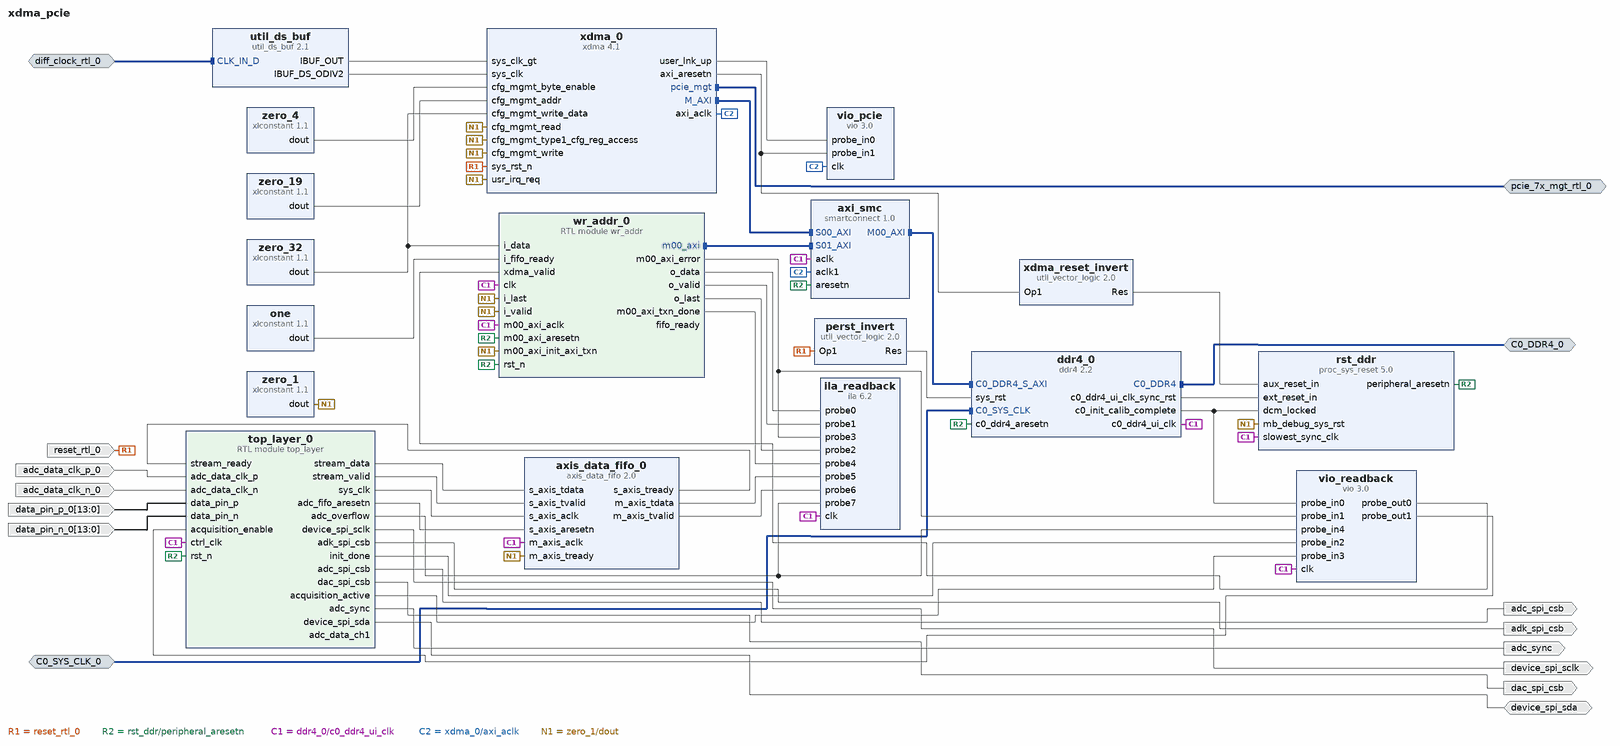
[diagram p0: block diagram of the top level]
# Vivado block design xdma_pcie, xcku060-ffva1156-2-i, Vivado 2018.3
create_bd_design xdma_pcie

create_bd_intf_port -mode Master -vlnv xilinx.com:interface:ddr4_rtl:1.0 C0_DDR4_0
create_bd_intf_port -mode Slave -vlnv xilinx.com:interface:diff_clock_rtl:1.0 C0_SYS_CLK_0
create_bd_intf_port -mode Master -vlnv xilinx.com:interface:pcie_7x_mgt_rtl:1.0 pcie_7x_mgt_rtl_0
create_bd_intf_port -mode Slave -vlnv xilinx.com:interface:diff_clock_rtl:1.0 diff_clock_rtl_0
set_property -dict {CONFIG.FREQ_HZ 100000000} [get_bd_intf_ports diff_clock_rtl_0]
create_bd_port -dir I -type rst reset_rtl_0
set_property -dict {CONFIG.POLARITY ACTIVE_LOW} [get_bd_ports reset_rtl_0]
create_bd_port -dir I -type clk adc_data_clk_p_0
set_property -dict {CONFIG.FREQ_HZ 125000000} [get_bd_ports adc_data_clk_p_0]
create_bd_port -dir I -type clk adc_data_clk_n_0
set_property -dict {CONFIG.FREQ_HZ 125000000} [get_bd_ports adc_data_clk_n_0]
create_bd_port -dir I -from 13 -to 0 data_pin_p_0
create_bd_port -dir I -from 13 -to 0 data_pin_n_0
create_bd_port -dir O device_spi_sclk
create_bd_port -dir O adk_spi_csb
create_bd_port -dir O adc_spi_csb
create_bd_port -dir O dac_spi_csb
create_bd_port -dir O adc_sync
create_bd_port -dir IO device_spi_sda

create_bd_cell -type ip -vlnv xilinx.com:ip:ddr4:2.2 ddr4_0
set_property -dict [list \
  CONFIG.C0.BANK_GROUP_WIDTH 1 \
  CONFIG.C0.DDR4_AxiAddressWidth 32 \
  CONFIG.C0.DDR4_AxiDataWidth 512 \
  CONFIG.C0.DDR4_CasLatency 11 \
  CONFIG.C0.DDR4_CasWriteLatency 9 \
  CONFIG.C0.DDR4_DataWidth 64 \
  CONFIG.C0.DDR4_InputClockPeriod 10000 \
  CONFIG.C0.DDR4_MemoryPart MT40A512M16HA-083E \
  CONFIG.C0.DDR4_Specify_MandD false \
  CONFIG.C0.DDR4_TimePeriod 1250 \
  CONFIG.System_Clock Differential \
] [get_bd_cells ddr4_0]
create_bd_cell -type ip -vlnv xilinx.com:ip:xdma:4.1 xdma_0
set_property -dict [list \
  CONFIG.PF0_DEVICE_ID_mqdma 9028 \
  CONFIG.PF2_DEVICE_ID_mqdma 9028 \
  CONFIG.PF3_DEVICE_ID_mqdma 9028 \
  CONFIG.axi_data_width 256_bit \
  CONFIG.axilite_master_en false \
  CONFIG.axisten_freq 125 \
  CONFIG.en_gt_selection true \
  CONFIG.pcie_blk_locn X0Y1 \
  CONFIG.pf0_device_id 8028 \
  CONFIG.pl_link_cap_max_link_speed 5.0_GT/s \
  CONFIG.pl_link_cap_max_link_width X8 \
  CONFIG.plltype QPLL1 \
  CONFIG.select_quad GTH_Quad_227 \
  CONFIG.xdma_axi_intf_mm AXI_Memory_Mapped \
  CONFIG.xdma_axilite_slave false \
] [get_bd_cells xdma_0]
create_bd_cell -type ip -vlnv xilinx.com:ip:util_ds_buf:2.1 util_ds_buf
set_property -dict {CONFIG.C_BUF_TYPE IBUFDSGTE} [get_bd_cells util_ds_buf]
create_bd_cell -type ip -vlnv xilinx.com:ip:axis_data_fifo:2.0 axis_data_fifo_0
set_property -dict [list \
  CONFIG.FIFO_DEPTH 4096 \
  CONFIG.FIFO_MODE 1 \
  CONFIG.HAS_TKEEP 0 \
  CONFIG.HAS_TLAST 0 \
  CONFIG.HAS_TSTRB 0 \
  CONFIG.IS_ACLK_ASYNC 1 \
  CONFIG.TDATA_NUM_BYTES 4 \
  CONFIG.TID_WIDTH 0 \
  CONFIG.TUSER_WIDTH 0 \
] [get_bd_cells axis_data_fifo_0]
create_bd_cell -type ip -vlnv xilinx.com:ip:smartconnect:1.0 axi_smc
set_property -dict {CONFIG.NUM_CLKS 2 CONFIG.NUM_MI 1 CONFIG.NUM_SI 2} [get_bd_cells axi_smc]
create_bd_cell -type ip -vlnv xilinx.com:ip:util_vector_logic:2.0 perst_invert
set_property -dict {CONFIG.C_OPERATION not CONFIG.C_SIZE 1} [get_bd_cells perst_invert]
create_bd_cell -type ip -vlnv xilinx.com:ip:util_vector_logic:2.0 xdma_reset_invert
set_property -dict {CONFIG.C_OPERATION not CONFIG.C_SIZE 1} [get_bd_cells xdma_reset_invert]
create_bd_cell -type ip -vlnv xilinx.com:ip:proc_sys_reset:5.0 rst_ddr
set_property -dict {CONFIG.C_AUX_RESET_HIGH 1} [get_bd_cells rst_ddr]
create_bd_cell -type ip -vlnv xilinx.com:ip:xlconstant:1.1 zero_1
set_property -dict {CONFIG.CONST_VAL 0 CONFIG.CONST_WIDTH 1} [get_bd_cells zero_1]
create_bd_cell -type ip -vlnv xilinx.com:ip:xlconstant:1.1 zero_4
set_property -dict {CONFIG.CONST_VAL 0 CONFIG.CONST_WIDTH 4} [get_bd_cells zero_4]
create_bd_cell -type ip -vlnv xilinx.com:ip:xlconstant:1.1 zero_19
set_property -dict {CONFIG.CONST_VAL 0 CONFIG.CONST_WIDTH 19} [get_bd_cells zero_19]
create_bd_cell -type ip -vlnv xilinx.com:ip:xlconstant:1.1 zero_32
set_property -dict {CONFIG.CONST_VAL 0 CONFIG.CONST_WIDTH 32} [get_bd_cells zero_32]
create_bd_cell -type ip -vlnv xilinx.com:ip:xlconstant:1.1 one
set_property -dict {CONFIG.CONST_VAL 1} [get_bd_cells one]
create_bd_cell -type ip -vlnv xilinx.com:ip:vio:3.0 vio_readback
set_property -dict [list \
  CONFIG.C_NUM_PROBE_IN 5 \
  CONFIG.C_NUM_PROBE_OUT 2 \
  CONFIG.C_PROBE_OUT0_INIT_VAL 0x0 \
  CONFIG.C_PROBE_OUT1_INIT_VAL 0x0 \
] [get_bd_cells vio_readback]
create_bd_cell -type ip -vlnv xilinx.com:ip:ila:6.2 ila_readback
set_property -dict [list \
  CONFIG.C_DATA_DEPTH 1024 \
  CONFIG.C_MONITOR_TYPE Native \
  CONFIG.C_NUM_OF_PROBES 8 \
  CONFIG.C_PROBE0_WIDTH 32 \
  CONFIG.C_PROBE1_WIDTH 1 \
  CONFIG.C_PROBE2_WIDTH 1 \
  CONFIG.C_PROBE3_WIDTH 1 \
  CONFIG.C_PROBE4_WIDTH 1 \
  CONFIG.C_PROBE5_WIDTH 32 \
  CONFIG.C_PROBE6_WIDTH 1 \
  CONFIG.C_PROBE7_WIDTH 1 \
] [get_bd_cells ila_readback]
create_bd_cell -type ip -vlnv xilinx.com:ip:vio:3.0 vio_pcie
set_property -dict {CONFIG.C_NUM_PROBE_IN 2 CONFIG.C_NUM_PROBE_OUT 0} [get_bd_cells vio_pcie]
create_bd_cell -type module -reference wr_addr wr_addr_0
create_bd_cell -type module -reference top_layer top_layer_0

# ---- connections ----

connect_bd_intf_net [get_bd_intf_ports C0_DDR4_0] [get_bd_intf_pins ddr4_0/C0_DDR4]
connect_bd_intf_net -intf_net diff_clock_rtl_0_1 [get_bd_intf_ports diff_clock_rtl_0] [get_bd_intf_pins util_ds_buf/CLK_IN_D]
connect_bd_intf_net [get_bd_intf_ports pcie_7x_mgt_rtl_0] [get_bd_intf_pins xdma_0/pcie_mgt]
connect_bd_intf_net -intf_net C0_SYS_CLK_0_1 [get_bd_intf_ports C0_SYS_CLK_0] [get_bd_intf_pins ddr4_0/C0_SYS_CLK]
connect_bd_intf_net [get_bd_intf_pins xdma_0/M_AXI] [get_bd_intf_pins axi_smc/S00_AXI]
connect_bd_intf_net [get_bd_intf_pins wr_addr_0/m00_axi] [get_bd_intf_pins axi_smc/S01_AXI]
connect_bd_intf_net [get_bd_intf_pins axi_smc/M00_AXI] [get_bd_intf_pins ddr4_0/C0_DDR4_S_AXI]
connect_bd_net -net reset_rtl_0_1 [get_bd_ports reset_rtl_0] [get_bd_pins xdma_0/sys_rst_n] [get_bd_pins perst_invert/Op1]
connect_bd_net [get_bd_pins util_ds_buf/IBUF_OUT] [get_bd_pins xdma_0/sys_clk_gt]
connect_bd_net [get_bd_pins util_ds_buf/IBUF_DS_ODIV2] [get_bd_pins xdma_0/sys_clk]
connect_bd_net -net AXI_data_out_0_0_data [get_bd_pins top_layer_0/stream_data] [get_bd_pins axis_data_fifo_0/s_axis_tdata]
connect_bd_net -net AXI_data_out_0_0_valid [get_bd_pins top_layer_0/stream_valid] [get_bd_pins axis_data_fifo_0/s_axis_tvalid]
connect_bd_net [get_bd_pins axis_data_fifo_0/s_axis_tready] [get_bd_pins top_layer_0/stream_ready]
connect_bd_net [get_bd_pins rst_ddr/peripheral_aresetn] \
  [get_bd_pins ddr4_0/c0_ddr4_aresetn] [get_bd_pins axi_smc/aresetn] [get_bd_pins wr_addr_0/rst_n] \
  [get_bd_pins wr_addr_0/m00_axi_aresetn] [get_bd_pins top_layer_0/rst_n]
connect_bd_net [get_bd_pins perst_invert/Res] [get_bd_pins ddr4_0/sys_rst]
connect_bd_net [get_bd_pins xdma_0/axi_aresetn] [get_bd_pins xdma_reset_invert/Op1] [get_bd_pins vio_pcie/probe_in1]
connect_bd_net [get_bd_pins ddr4_0/c0_ddr4_ui_clk_sync_rst] [get_bd_pins rst_ddr/ext_reset_in]
connect_bd_net [get_bd_pins xdma_reset_invert/Res] [get_bd_pins rst_ddr/aux_reset_in]
connect_bd_net [get_bd_pins ddr4_0/c0_init_calib_complete] [get_bd_pins rst_ddr/dcm_locked] [get_bd_pins vio_readback/probe_in0]
connect_bd_net [get_bd_pins ddr4_0/c0_ddr4_ui_clk] \
  [get_bd_pins axi_smc/aclk] [get_bd_pins rst_ddr/slowest_sync_clk] [get_bd_pins vio_readback/clk] \
  [get_bd_pins ila_readback/clk] [get_bd_pins wr_addr_0/clk] [get_bd_pins wr_addr_0/m00_axi_aclk] \
  [get_bd_pins top_layer_0/ctrl_clk] [get_bd_pins axis_data_fifo_0/m_axis_aclk]
connect_bd_net [get_bd_pins xdma_0/axi_aclk] [get_bd_pins axi_smc/aclk1] [get_bd_pins vio_pcie/clk]
connect_bd_net [get_bd_pins axis_data_fifo_0/m_axis_tdata] [get_bd_pins ila_readback/probe5]
connect_bd_net [get_bd_pins axis_data_fifo_0/m_axis_tvalid] [get_bd_pins ila_readback/probe6]
# net wr_addr_0_fifo_ready has one end: wr_addr_0/fifo_ready
connect_bd_net [get_bd_pins zero_1/dout] \
  [get_bd_pins rst_ddr/mb_debug_sys_rst] [get_bd_pins xdma_0/usr_irq_req] [get_bd_pins xdma_0/cfg_mgmt_read] \
  [get_bd_pins xdma_0/cfg_mgmt_write] [get_bd_pins xdma_0/cfg_mgmt_type1_cfg_reg_access] \
  [get_bd_pins wr_addr_0/m00_axi_init_axi_txn] [get_bd_pins axis_data_fifo_0/m_axis_tready] [get_bd_pins wr_addr_0/i_valid] \
  [get_bd_pins wr_addr_0/i_last]
connect_bd_net [get_bd_pins zero_4/dout] [get_bd_pins xdma_0/cfg_mgmt_byte_enable]
connect_bd_net [get_bd_pins zero_19/dout] [get_bd_pins xdma_0/cfg_mgmt_addr]
connect_bd_net [get_bd_pins zero_32/dout] [get_bd_pins xdma_0/cfg_mgmt_write_data] [get_bd_pins wr_addr_0/i_data]
connect_bd_net [get_bd_pins one/dout] [get_bd_pins wr_addr_0/i_fifo_ready]
connect_bd_net [get_bd_pins vio_readback/probe_out0] [get_bd_pins wr_addr_0/xdma_valid]
connect_bd_net [get_bd_pins wr_addr_0/m00_axi_error] [get_bd_pins vio_readback/probe_in1] [get_bd_pins ila_readback/probe3]
connect_bd_net [get_bd_pins wr_addr_0/o_data] [get_bd_pins ila_readback/probe0]
connect_bd_net [get_bd_pins wr_addr_0/o_valid] [get_bd_pins ila_readback/probe1]
connect_bd_net [get_bd_pins wr_addr_0/o_last] [get_bd_pins ila_readback/probe2]
connect_bd_net [get_bd_pins wr_addr_0/m00_axi_txn_done] [get_bd_pins ila_readback/probe4]
connect_bd_net [get_bd_pins xdma_0/user_lnk_up] [get_bd_pins vio_pcie/probe_in0]
connect_bd_net -net adc_data_clk_p_0_1 [get_bd_ports adc_data_clk_p_0] [get_bd_pins top_layer_0/adc_data_clk_p]
connect_bd_net -net adc_data_clk_n_0_1 [get_bd_ports adc_data_clk_n_0] [get_bd_pins top_layer_0/adc_data_clk_n]
connect_bd_net -net data_pin_p_0_1 [get_bd_ports data_pin_p_0] [get_bd_pins top_layer_0/data_pin_p]
connect_bd_net -net data_pin_n_0_1 [get_bd_ports data_pin_n_0] [get_bd_pins top_layer_0/data_pin_n]
# net top_layer_0_adc_data_ch1 has one end: top_layer_0/adc_data_ch1
connect_bd_net [get_bd_pins top_layer_0/device_spi_sclk] [get_bd_ports device_spi_sclk]
connect_bd_net [get_bd_pins top_layer_0/adk_spi_csb] [get_bd_ports adk_spi_csb]
connect_bd_net [get_bd_pins top_layer_0/adc_spi_csb] [get_bd_ports adc_spi_csb]
connect_bd_net [get_bd_pins top_layer_0/dac_spi_csb] [get_bd_ports dac_spi_csb]
connect_bd_net [get_bd_pins top_layer_0/adc_sync] [get_bd_ports adc_sync]
connect_bd_net [get_bd_ports device_spi_sda] [get_bd_pins top_layer_0/device_spi_sda]
connect_bd_net [get_bd_pins vio_readback/probe_out1] [get_bd_pins top_layer_0/acquisition_enable]
connect_bd_net [get_bd_pins top_layer_0/init_done] [get_bd_pins vio_readback/probe_in2]
connect_bd_net [get_bd_pins top_layer_0/sys_clk] [get_bd_pins axis_data_fifo_0/s_axis_aclk]
connect_bd_net [get_bd_pins top_layer_0/adc_fifo_aresetn] [get_bd_pins axis_data_fifo_0/s_axis_aresetn]
connect_bd_net [get_bd_pins top_layer_0/acquisition_active] [get_bd_pins vio_readback/probe_in3]
connect_bd_net [get_bd_pins top_layer_0/adc_overflow] [get_bd_pins vio_readback/probe_in4] [get_bd_pins ila_readback/probe7]

# ---- address map ----
assign_bd_address -offset 0x00000000 -range 4G -target_address_space [get_bd_addr_spaces wr_addr_0/m00_axi] [get_bd_addr_segs ddr4_0/C0_DDR4_MEMORY_MAP/C0_DDR4_ADDRESS_BLOCK]
assign_bd_address -offset 0x0000000000000000 -range 4G -target_address_space [get_bd_addr_spaces xdma_0/M_AXI] [get_bd_addr_segs ddr4_0/C0_DDR4_MEMORY_MAP/C0_DDR4_ADDRESS_BLOCK]

validate_bd_design
save_bd_design
